# Altium schematic sheet TYPE-C_INTERFACE_SHEET.SchDoc
size A4; SheetNumber: 1; SheetTotal: 23
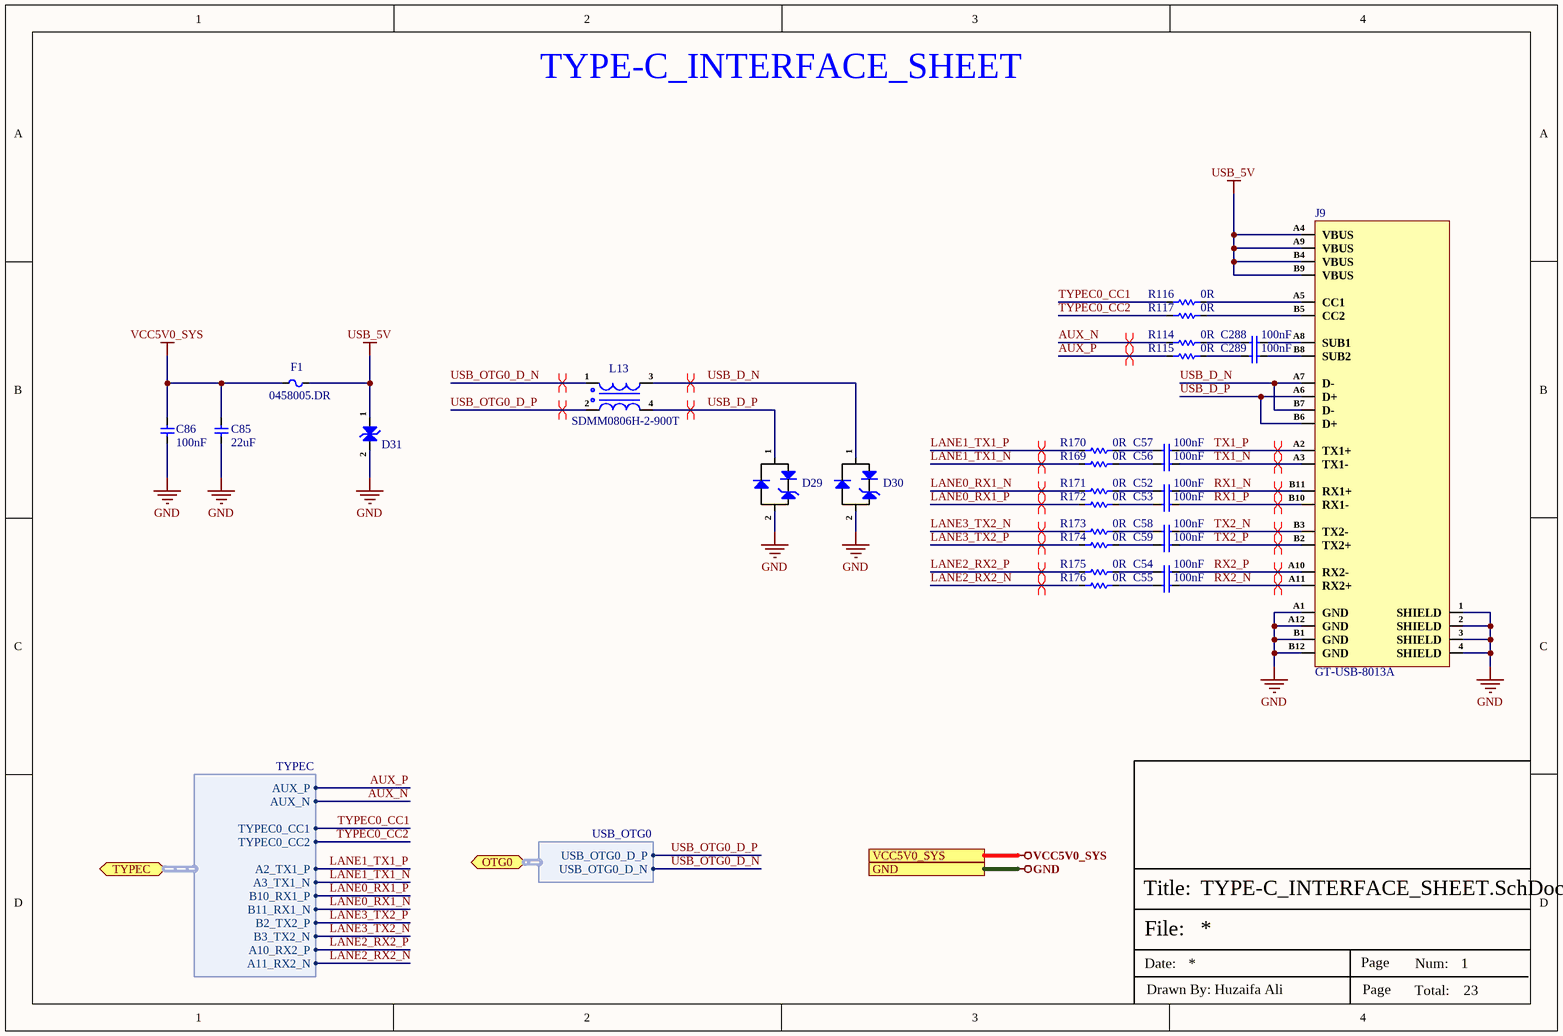
[diagram p0: TYPE-C_INTERFACE_SHEET.SchDoc]

## Parts
C52  100nF  [Cap-0402]
C53  100nF  [Cap-0402]
C54  100nF  [Cap-0402]
C55  100nF  [Cap-0402]
C56  100nF  [Cap-0402]
C57  100nF  [Cap-0402]
C58  100nF  [Cap-0402]
C59  100nF  [Cap-0402]
C85  22uF  [Cap-0603]
C86  100nF  [Cap-0402]
C288  100nF  [Cap-0402]
C289  100nF  [Cap-0402]
D29  ESD5341N-2/TR  [DFN1006-2L_]  (value not drawn)
D30  ESD5341N-2/TR  [DFN1006-2L_]  (value not drawn)
D31  ESD5451N  [DFN1006-2L (Bi-Directional)]  (value not drawn)
F1  0458005.DR  [Fuse 1206 (3216 Metric)]
J9  GT-USB-8013A  [GT-USB-8013A]
L13  SDMM0806H-2-900T  [0302]
R114  0R  [Res-0402]
R115  0R  [Res-0402]
R116  0R  [Res-0402]
R117  0R  [Res-0402]
R169  0R  [Res-0402]
R170  0R  [Res-0402]
R171  0R  [Res-0402]
R172  0R  [Res-0402]
R173  0R  [Res-0402]
R174  0R  [Res-0402]
R175  0R  [Res-0402]
R176  0R  [Res-0402]

## Ports
GND (see DRAM_LPDDR4_SHEET[6D], eMMC_SPI-FLASH_SHEET[1D], HDMI2.0_SHEET[3D], POWER_LDO_SHEET[3D], POWER_OTHER_SHEET[3C], POWER_PMIC_RK809_CODEC[3C], POWER_PMIC_RK809_DC DC[3D], POWER_PMIC_RK809_LDO[4C], POWER_PMIC_RK809_MGM[3D], RK3566_AUDIO_SHEET[3C], RK3566_DDR-PHY_SHEET[5D], RK3566_FLASH-SD_SHEET[4C], RK3566_OSC_PMUIO_SHEET[5D], RK3566_POWER_SHEET[3D], RK3566_SARADC_GPIO[3D], RK3566_USB_PCIe_SHEET[3D], RK3566_VI_SHEET[3D], RK3566_VO_SHEET_1[3C], RK3566_VO_SHEET_2[4C], TYPE-C_TO_MIPI-CSI_SHEET[5D], USB2.0_SHEET[3D], WIFI-6_SHEET[3D]), OTG0 (bidir, harness USB_OTG0, see RK3566_USB_PCIe_SHEET[3C]), TYPEC (bidir, harness TYPEC, see TYPE-C_TO_MIPI-CSI_SHEET[2D]), VCC5V0_SYS (see HDMI2.0_SHEET[3D], POWER_LDO_SHEET[3D], POWER_OTHER_SHEET[3C], POWER_PMIC_RK809_CODEC[3C], POWER_PMIC_RK809_MGM[3D], RK3566_USB_PCIe_SHEET[3C], USB2.0_SHEET[3D])

## Harnesses
USB_OTG0: USB_OTG0_D_P, USB_OTG0_D_N
TYPEC: TYPEC0_CC1, TYPEC0_CC2, AUX_N, AUX_P, A2_TX1_P, A3_TX1_N, B11_RX1_N, B10_RX1_P, B3_TX2_N, B2_TX2_P, A10_RX2_P, A11_RX2_N

## Nets
GND: C85.1 C86.1 D29.2(A) D30.2(A) D31.2(K) J9.1(SHIELD) J9.2(SHIELD) J9.3(SHIELD) J9.4(SHIELD) J9.A1(GND) J9.A12(GND) J9.B1(GND) J9.B12(GND) ; port GND
USB_5V: D31.1(K) F1.1 J9.A4(VBUS) J9.A9(VBUS) J9.B4(VBUS) J9.B9(VBUS)
VCC5V0_SYS: C85.2 C86.2 F1.2 ; port VCC5V0_SYS
AUX_N: R114.1 ; port TYPEC.AUX_N
AUX_P: R115.1 ; port TYPEC.AUX_P
LANE0_RX1_N: R171.1 ; port TYPEC.B11_RX1_N
LANE0_RX1_P: R172.1 ; port TYPEC.B10_RX1_P
LANE1_TX1_N: R169.1 ; port TYPEC.A3_TX1_N
LANE1_TX1_P: R170.1 ; port TYPEC.A2_TX1_P
LANE2_RX2_N: R176.1 ; port TYPEC.A11_RX2_N
LANE2_RX2_P: R175.1 ; port TYPEC.A10_RX2_P
LANE3_TX2_N: R173.1 ; port TYPEC.B3_TX2_N
LANE3_TX2_P: R174.1 ; port TYPEC.B2_TX2_P
RX1_N: C52.1 J9.B11(RX1+)
RX1_P: C53.1 J9.B10(RX1-)
RX2_N: C55.1 J9.A11(RX2+)
RX2_P: C54.1 J9.A10(RX2-)
TX1_N: C56.1 J9.A3(TX1-)
TX1_P: C57.1 J9.A2(TX1+)
TX2_N: C58.1 J9.B3(TX2-)
TX2_P: C59.1 J9.B2(TX2+)
TYPEC0_CC1: R116.1 ; port TYPEC.TYPEC0_CC1
TYPEC0_CC2: R117.1 ; port TYPEC.TYPEC0_CC2
USB_D_N: D30.1(K) J9.A7(D-) J9.B7(D-) L13.3
USB_D_P: D29.1(K) J9.A6(D+) J9.B6(D+) L13.4
USB_OTG0_D_N: L13.1 ; port OTG0.USB_OTG0_D_N
USB_OTG0_D_P: L13.2 ; port OTG0.USB_OTG0_D_P
NetC52_2: C52.2 R171.2
NetC53_2: C53.2 R172.2
NetC54_2: C54.2 R175.2
NetC55_2: C55.2 R176.2
NetC56_2: C56.2 R169.2
NetC57_2: C57.2 R170.2
NetC58_2: C58.2 R173.2
NetC59_2: C59.2 R174.2
NetC288_1: C288.1 J9.A8(SUB1)
NetC288_2: C288.2 R114.2
NetC289_1: C289.1 J9.B8(SUB2)
NetC289_2: C289.2 R115.2
NetJ9_A5: J9.A5(CC1) R116.2
NetJ9_B5: J9.B5(CC2) R117.2

## Layout directives
differential pair; differential pair class TYPEC_DP_LINES_90: AUX_N, AUX_P, LANE0_RX1_N, LANE0_RX1_P, LANE1_TX1_N, LANE1_TX1_P, LANE2_RX2_N, LANE2_RX2_P, LANE3_TX2_N, LANE3_TX2_P, RX1_N, RX1_P, RX2_N, RX2_P, TX1_N, TX1_P, TX2_N, TX2_P, USB_D_N, USB_D_P, USB_OTG0_D_N, USB_OTG0_D_P

## Notes on the sheet
- TYPE-C_INTERFACE_SHEET
- File:
- Title:
- Date:
- Page
- Num:
- Total:
- Drawn By: Huzaifa Ali

## Library data of the parts
C52-C59 C86 C288 C289 = CC0402KRX5R7BB104: CAP CER 0.1UF 16V X5R 0402; Manufacturer: Yageo; Tolerance: 10%; Supplier 1: Mouser; Manufacturer Part Number: CC0402KRX5R7BB104; RoHS: Yes; Category: Ceramic Capacitors; Stock 1: 936792; Pricing 1: 1=0.10000, 10=0.02300, 50=0.02300, 100=0.01100, 1000=0.00600, 10000=0.00400 (USD); Mount: Surface Mount; Case/Package: 0402; Case Code (Imperial): 0402; Case Code (Metric): 1005; Min Operating Temperature: -55°C; Max Operating Temperature: 85°C; Capacitance: 100nF; Dielectric: X5R; Voltage Rating (DC): 16V; Packaging: Tape and Reel; Termination: SMD/SMT; Resistor Type: Ceramic; Voltage Rating: 16V; Series: CC; Construction: Flat; Length: 1mm; Width: 0.02inch; Height: 0.5mm; Thickness: 0.022inch; Depth: 0.5mm; Radiation Hardening: No; Lead Free: Lead Free; Halogen Free: Halogen Free; RoHS Compliant: Yes; ComponentLink1URL: https://datasheet.ciiva.com/155/mlccorderingcode-155879.pdf?src-supplier=Digi-Key; ComponentLink1Description: https://datasheet.ciiva.com/155/mlccorderingcode-155879.pdf?src-supplier=Digi-Key; Supplier Part Number 1: 603-CC402KRX5R7BB104; LCSC Part Number: C106204; Number of Pins: 2; Package Quantity: 1; REACH SVHC: Unknown; ComponentLink2URL: https://datasheet.ciiva.com/155/mlccorderingcode-155878.pdf?src-supplier=Digi-Key; ComponentLink2Description: https://datasheet.ciiva.com/155/mlccorderingcode-155878.pdf?src-supplier=Digi-Key; ComponentLink3URL: https://datasheet.ciiva.com/155/mlccorderingcode-155880.pdf?src-supplier=Digi-Key; ComponentLink3Description: https://datasheet.ciiva.com/155/mlccorderingcode-155880.pdf?src-supplier=Digi-Key; ComponentLink4URL: https://datasheet.ciiva.com/11464/upy-gphc-x5r-4v-to-50v-12-11464869.pdf?src-supplier=Avnet; ComponentLink4Description: https://datasheet.ciiva.com/11464/upy-gphc-x5r-4v-to-50v-12-11464869.pdf?src-supplier=Avnet
C85 = HGC0603R5226M160NTHJ: 16V 22uF X5R ±20% 0603 Multilayer Ceramic Capacitors MLCC - SMD/SMT ROHS; Manufacturer: Chinocera; Manufacturer Part Number: HGC0603R5226M160NTHJ; ComponentLink1URL: https://www.lcsc.com/product-detail/Multilayer-Ceramic-Capacitors-MLCC-SMD-SMT_Chinocera-HGC0603R5226M160NTHJ_C22367828.html; ComponentLink1Description: LCSC; LCSC Part Number: C22367828; Item Type: Capacitor; Package: 0603
D29 D30 = ESD5341N-2/TR: 4A@8/20us 15V 7V 5V Unidirectional DFN1006-2L TVS ROHS; Manufacturer: WILLSEMI; Item Type: Diode; Manufacturer Part Number: ESD5341N-2/TR; Package: DFN1006-2L; ComponentLink1Description: LCSC; ComponentLink1URL: https://www.lcsc.com/product-detail/TVS_WILLSEMI-Will-Semicon-ESD5341N-2-TR_C239773.html; LCSC Part Number: C239773
D31 = ESD5451N: DFN1006-2(0402) ESD Protection Devices ROHS; Manufacturer: TECH PUBLIC; Manufacturer Part Number: ESD5451N; Footprint: DFN1006-2(0402); ComponentLink1Description: LCSC; ComponentLink1URL: https://www.lcsc.com/product-detail/span-style-background-color-ff0-ESD-span-Protection-Devices_TECH-PUBLIC-ESD5451N_C2936977.html; LCSC Part Number: C2936977
F1 = 0458005.DR: FUSE BRD MNT 5A 32VAC 75VDC 1206; Manufacturer: Littelfuse; Supplier: Rs; Supplier Part Number: 1740294; Manufacturer Part Number: 0458005.DR; RoHS: Yes; Category: Fuses; Stock: 1005; Pricing: 1=0.6241, 10=0.73892, 25=0.71895, 50=0.70003 (GBP); ComponentLink1URL: https://datasheet.ciiva.com/1730/337915-1730547.pdf?src-supplier=Newark; ComponentLink1Description: https://datasheet.ciiva.com/1730/337915-1730547.pdf?src-supplier=Newark; ComponentLink2URL: https://datasheet.ciiva.com/7991/337915-7991910.pdf?src-supplier=Element14; ComponentLink2Description: https://datasheet.ciiva.com/7991/337915-7991910.pdf?src-supplier=Element14; ComponentLink3URL: https://datasheet.ciiva.com/299/littelfuse-fuse-458-series-299786.pdf?src-supplier=Digikey; ComponentLink3Description: https://datasheet.ciiva.com/299/littelfuse-fuse-458-series-299786.pdf?src-supplier=Digikey; ComponentLink4URL: https://datasheet.ciiva.com/299/littelfuse-fuse-458-series-299787.pdf?src-supplier=Digikey; ComponentLink4Description: https://datasheet.ciiva.com/299/littelfuse-fuse-458-series-299787.pdf?src-supplier=Digikey; ComponentLink5URL: https://datasheet.ciiva.com/299/littelfuse-fuse-458-series-299788.pdf?src-supplier=Digikey; ComponentLink5Description: https://datasheet.ciiva.com/299/littelfuse-fuse-458-series-299788.pdf?src-supplier=Digikey; LCSC Part Number: C187561; Item Type: Fuse
J9 = GT-USB-8013A: 5A USB 3.1 1 Horizontal attachment 24P Male -40℃~+85℃ Type-C SMD USB Connectors ROHS; Manufacturer: G-Switch; Manufacturer Part Number: GT-USB-8013A; Package: SMD; LCSC Part Number: C2988370; Item Type: Connector; ComponentLink1Description: LCSC; ComponentLink1URL: https://www.lcsc.com/product-detail/span-style-background-color-ff0-USB-span-Connectors_G-Switch-GT-USB-8013A_C2988370.html
L13 = SDMM0806H-2-900T: 90Ω@100MHz 4Ω 2 0302 Common Mode Filters ROHS; Manufacturer: Sunlord; Manufacturer Part Number: SDMM0806H-2-900T; Package: 0302; LCSC Part Number: C370285; Item Type: Common Mode Filter; ComponentLink1Description: LCSC; ComponentLink1URL: https://www.lcsc.com/product-detail/Common-Mode-Filters_Sunlord-SDMM0806H-2-900T_C370285.html
R114-R117 R169-R176 = RC0402FR-070RL: RES 0 OHM JUMPER 1/16W 0402; Manufacturer: Yageo; Power Rating: 62.5mW; Tolerance: 1%; Voltage Rating: 50V; Max Power Dissipation: 63mW; Item Type: Resistors; Temperature Coefficient: 200ppm/°C; Supplier 1: Mouser; Manufacturer Part Number: RC0402FR-070RL; RoHS: Yes; Stock 1: 8556842; Pricing 1: 1=0.10000, 10=0.01400, 50=0.01400, 100=0.00600, 1000=0.00300, 5000=0.00200, 10000=0.00100 (USD); Case/Package: 0402; Contact Plating: Tin,Matte; Case Code (Metric): 1005; Case Code (Imperial): 0402; Size Code: 0402; Min Operating Temperature: -55°C; Max Operating Temperature: 155°C; Resistor Type: Thick Film; Resistance: 0R; Packaging: Tape and Reel; Number of Terminations: 2; Termination: SMD/SMT; Features: Moisture Resistant; Series: RC; Length: 1mm; Width: 0.5mm; Height: 0.35mm; Radiation Hardening: No; RoHS Compliant: Yes; Lead Free: Lead Free; ComponentLink1URL: https://datasheet.ciiva.com/8896/pyu-rc0402-51-rohs-l-6-8896149.pdf?src-supplier=Avnet; ComponentLink1Description: https://datasheet.ciiva.com/8896/pyu-rc0402-51-rohs-l-6-8896149.pdf?src-supplier=Avnet; ComponentLink2URL: https://datasheet.ciiva.com/16790/pyu-rc0402-51-rohs-l-6-r-16790444.pdf?src-supplier=Future+Electronics; ComponentLink2Description: https://datasheet.ciiva.com/16790/pyu-rc0402-51-rohs-l-6-r-16790444.pdf?src-supplier=Future+Electronics; Supplier Part Number 1: 603-RC0402FR-070RL; LCSC Part Number: C106231; Mount: Surface Mount